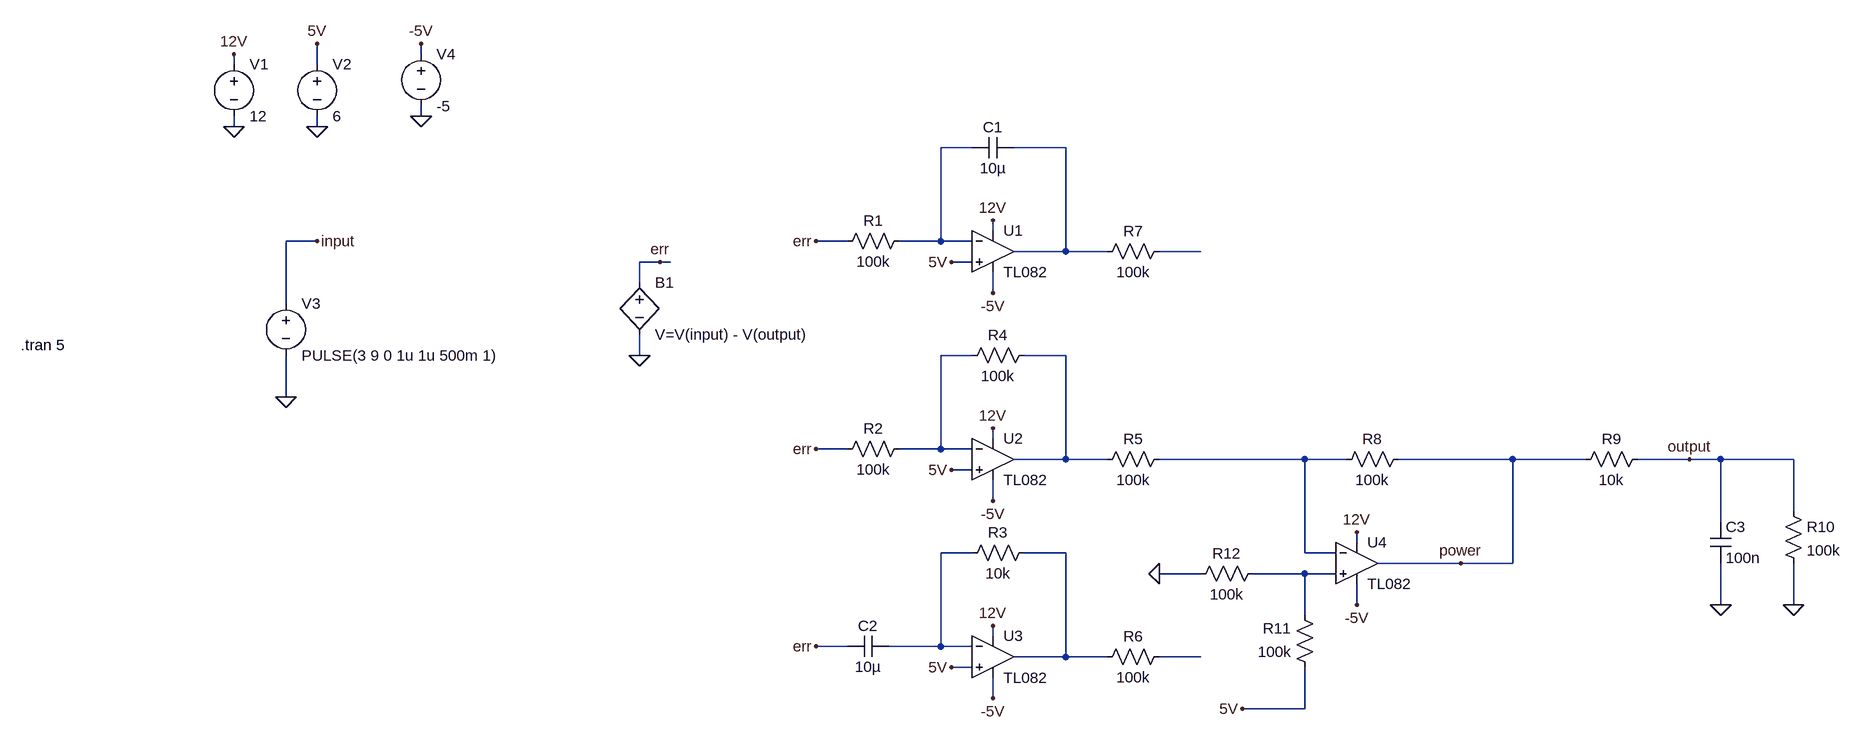
[diagram p0: schematic PID.asc]
PID.asc, the LTspice schematic file:
Version 4
SHEET 1 1936 932
WIRE -256 -144 -256 -160
WIRE -544 -128 -544 -144
WIRE -416 -128 -416 -160
WIRE -256 -48 -256 -64
WIRE -544 -32 -544 -48
WIRE -416 -32 -416 -48
WIRE 592 0 544 0
WIRE 736 0 656 0
WIRE 624 128 624 112
WIRE -416 144 -464 144
WIRE 400 144 352 144
WIRE 544 144 544 0
WIRE 544 144 480 144
WIRE 592 144 544 144
WIRE 736 160 736 0
WIRE 736 160 656 160
WIRE 800 160 736 160
WIRE 944 160 880 160
WIRE 112 176 80 176
WIRE 128 176 112 176
WIRE 592 176 560 176
WIRE 80 208 80 176
WIRE 624 224 624 192
WIRE -464 240 -464 144
WIRE 80 320 80 288
WIRE 592 320 544 320
WIRE 736 320 672 320
WIRE -464 384 -464 320
WIRE 624 448 624 432
WIRE 400 464 352 464
WIRE 544 464 544 320
WIRE 544 464 480 464
WIRE 592 464 544 464
WIRE 736 480 736 320
WIRE 736 480 656 480
WIRE 800 480 736 480
WIRE 1104 480 880 480
WIRE 1168 480 1104 480
WIRE 1424 480 1248 480
WIRE 1536 480 1424 480
WIRE 1696 480 1616 480
WIRE 1744 480 1696 480
WIRE 1856 480 1744 480
WIRE 592 496 560 496
WIRE 624 544 624 512
WIRE 1856 560 1856 480
WIRE 1744 576 1744 480
WIRE 1184 608 1184 592
WIRE 592 624 544 624
WIRE 736 624 672 624
WIRE 1104 624 1104 480
WIRE 1152 624 1104 624
WIRE 1344 640 1216 640
WIRE 1424 640 1424 480
WIRE 1424 640 1344 640
WIRE 944 656 880 656
WIRE 1104 656 1024 656
WIRE 1152 656 1104 656
WIRE 1184 704 1184 672
WIRE 1744 704 1744 640
WIRE 1856 704 1856 640
WIRE 1104 720 1104 656
WIRE 624 752 624 736
WIRE 400 768 352 768
WIRE 544 768 544 624
WIRE 544 768 464 768
WIRE 592 768 544 768
WIRE 736 784 736 624
WIRE 736 784 656 784
WIRE 800 784 736 784
WIRE 944 784 880 784
WIRE 592 800 560 800
WIRE 624 848 624 816
WIRE 1104 864 1104 800
WIRE 1104 864 1008 864
FLAG 624 112 12V
FLAG 560 176 5V
FLAG -416 -160 5V
FLAG -544 -32 0
FLAG -544 -144 12V
FLAG -416 -32 0
FLAG -464 384 0
FLAG -416 144 input
FLAG 352 144 err
FLAG 624 432 12V
FLAG 560 496 5V
FLAG 352 464 err
FLAG 624 736 12V
FLAG 560 800 5V
FLAG 352 768 err
FLAG 1184 592 12V
FLAG 1008 864 5V
FLAG 1344 640 power
FLAG 80 320 0
FLAG 624 224 -5V
FLAG 624 544 -5V
FLAG 624 848 -5V
FLAG 1184 704 -5V
FLAG -256 -48 0
FLAG -256 -160 -5V
FLAG 112 176 err
FLAG 1744 704 0
FLAG 1856 704 0
FLAG 1696 480 output
FLAG 880 656 0
SYMBOL ZZZ\\OpAmp\\TL082 624 160 R0
SYMATTR InstName U1
SYMBOL cap 656 -16 R90
WINDOW 0 0 32 VBottom 2
WINDOW 3 32 32 VTop 2
SYMATTR InstName C1
SYMATTR Value 10µ
SYMBOL res 496 128 R90
WINDOW 0 0 56 VBottom 2
WINDOW 3 32 56 VTop 2
SYMATTR InstName R1
SYMATTR Value 100k
SYMBOL voltage -544 -144 R0
WINDOW 123 0 0 Left 0
WINDOW 39 0 0 Left 0
SYMATTR InstName V1
SYMATTR Value 12
SYMBOL voltage -416 -144 R0
WINDOW 123 0 0 Left 0
WINDOW 39 0 0 Left 0
SYMATTR InstName V2
SYMATTR Value 6
SYMBOL voltage -464 224 R0
WINDOW 123 0 0 Left 0
WINDOW 39 0 0 Left 0
SYMATTR InstName V3
SYMATTR Value PULSE(3 9 0 1u 1u 500m 1)
SYMBOL ZZZ\\OpAmp\\TL082 624 480 R0
SYMATTR InstName U2
SYMBOL res 496 448 R90
WINDOW 0 0 56 VBottom 2
WINDOW 3 32 56 VTop 2
SYMATTR InstName R2
SYMATTR Value 100k
SYMBOL ZZZ\\OpAmp\\TL082 624 784 R0
SYMATTR InstName U3
SYMBOL cap 464 752 R90
WINDOW 0 0 32 VBottom 2
WINDOW 3 32 32 VTop 2
SYMATTR InstName C2
SYMATTR Value 10µ
SYMBOL res 688 608 R90
WINDOW 0 0 56 VBottom 2
WINDOW 3 32 56 VTop 2
SYMATTR InstName R3
SYMATTR Value 10k
SYMBOL res 688 304 R90
WINDOW 0 0 56 VBottom 2
WINDOW 3 32 56 VTop 2
SYMATTR InstName R4
SYMATTR Value 100k
SYMBOL ZZZ\\OpAmp\\TL082 1184 640 R0
SYMATTR InstName U4
SYMBOL res 896 464 R90
WINDOW 0 0 56 VBottom 2
WINDOW 3 32 56 VTop 2
SYMATTR InstName R5
SYMATTR Value 100k
SYMBOL res 896 768 R90
WINDOW 0 0 56 VBottom 2
WINDOW 3 32 56 VTop 2
SYMATTR InstName R6
SYMATTR Value 100k
SYMBOL res 896 144 R90
WINDOW 0 0 56 VBottom 2
WINDOW 3 32 56 VTop 2
SYMATTR InstName R7
SYMATTR Value 100k
SYMBOL res 1264 464 R90
WINDOW 0 0 56 VBottom 2
WINDOW 3 32 56 VTop 2
SYMATTR InstName R8
SYMATTR Value 100k
SYMBOL bv 80 192 R0
SYMATTR InstName B1
SYMATTR Value V=V(input) - V(output)
SYMBOL voltage -256 -160 R0
WINDOW 123 0 0 Left 0
WINDOW 39 0 0 Left 0
SYMATTR InstName V4
SYMATTR Value -5
SYMBOL res 1632 464 R90
WINDOW 0 0 56 VBottom 2
WINDOW 3 32 56 VTop 2
SYMATTR InstName R9
SYMATTR Value 10k
SYMBOL cap 1728 576 R0
SYMATTR InstName C3
SYMATTR Value 100n
SYMBOL res 1840 544 R0
SYMATTR InstName R10
SYMATTR Value 100k
SYMBOL res 1120 816 R180
WINDOW 0 36 76 Left 2
WINDOW 3 36 40 Left 2
SYMATTR InstName R11
SYMATTR Value 100k
SYMBOL res 928 672 R270
WINDOW 0 32 56 VTop 2
WINDOW 3 0 56 VBottom 2
SYMATTR InstName R12
SYMATTR Value 100k
TEXT -872 304 Left 2 !.tran 5

The netlist it stands for:
* PID.asc
* U1: TL082 (symbol ZZZ\OpAmp\TL082 not available, pins judged from their places): In+=5V In-=N001 V+=12V V-=-5V OUT=N002
C1 N002 N001 10µ
R1 N001 err 100k
V1 12V 0 12
V2 5V 0 6
V3 input 0 PULSE(3 9 0 1u 1u 500m 1)
* U2: TL082 (symbol ZZZ\OpAmp\TL082 not available, pins judged from their places): In+=5V In-=N004 V+=12V V-=-5V OUT=N005
R2 N004 err 100k
* U3: TL082 (symbol ZZZ\OpAmp\TL082 not available, pins judged from their places): In+=5V In-=N007 V+=12V V-=-5V OUT=N008
C2 N007 err 10µ
R3 N008 N007 10k
R4 N005 N004 100k
* U4: TL082 (symbol ZZZ\OpAmp\TL082 not available, pins judged from their places): In+=N009 In-=N006 V+=12V V-=-5V OUT=power
R5 N006 N005 100k
R6 N010 N008 100k
R7 N003 N002 100k
R8 power N006 100k
B1 err 0 V=V(input) - V(output)
V4 -5V 0 -5
R9 output power 10k
C3 output 0 100n
R10 output 0 100k
R11 5V N009 100k
R12 0 N009 100k
.tran 5
.backanno
.end